# EasyEDA Pro project dtu-core-v2.epro

# Schematic Schematic1

## Sheets
1 P1: Assembly Variant: Basic; Board Name: Board1; Create Date: 2026-10-09; Page Name: P1; Project Name: DTU-C5-Air780EPT-HW-V0.1; Schematic Name: Schematic1; Update Date: 2026-10-09; Company: 嘉立创EDA; Page Size: A4; Version: V1.0
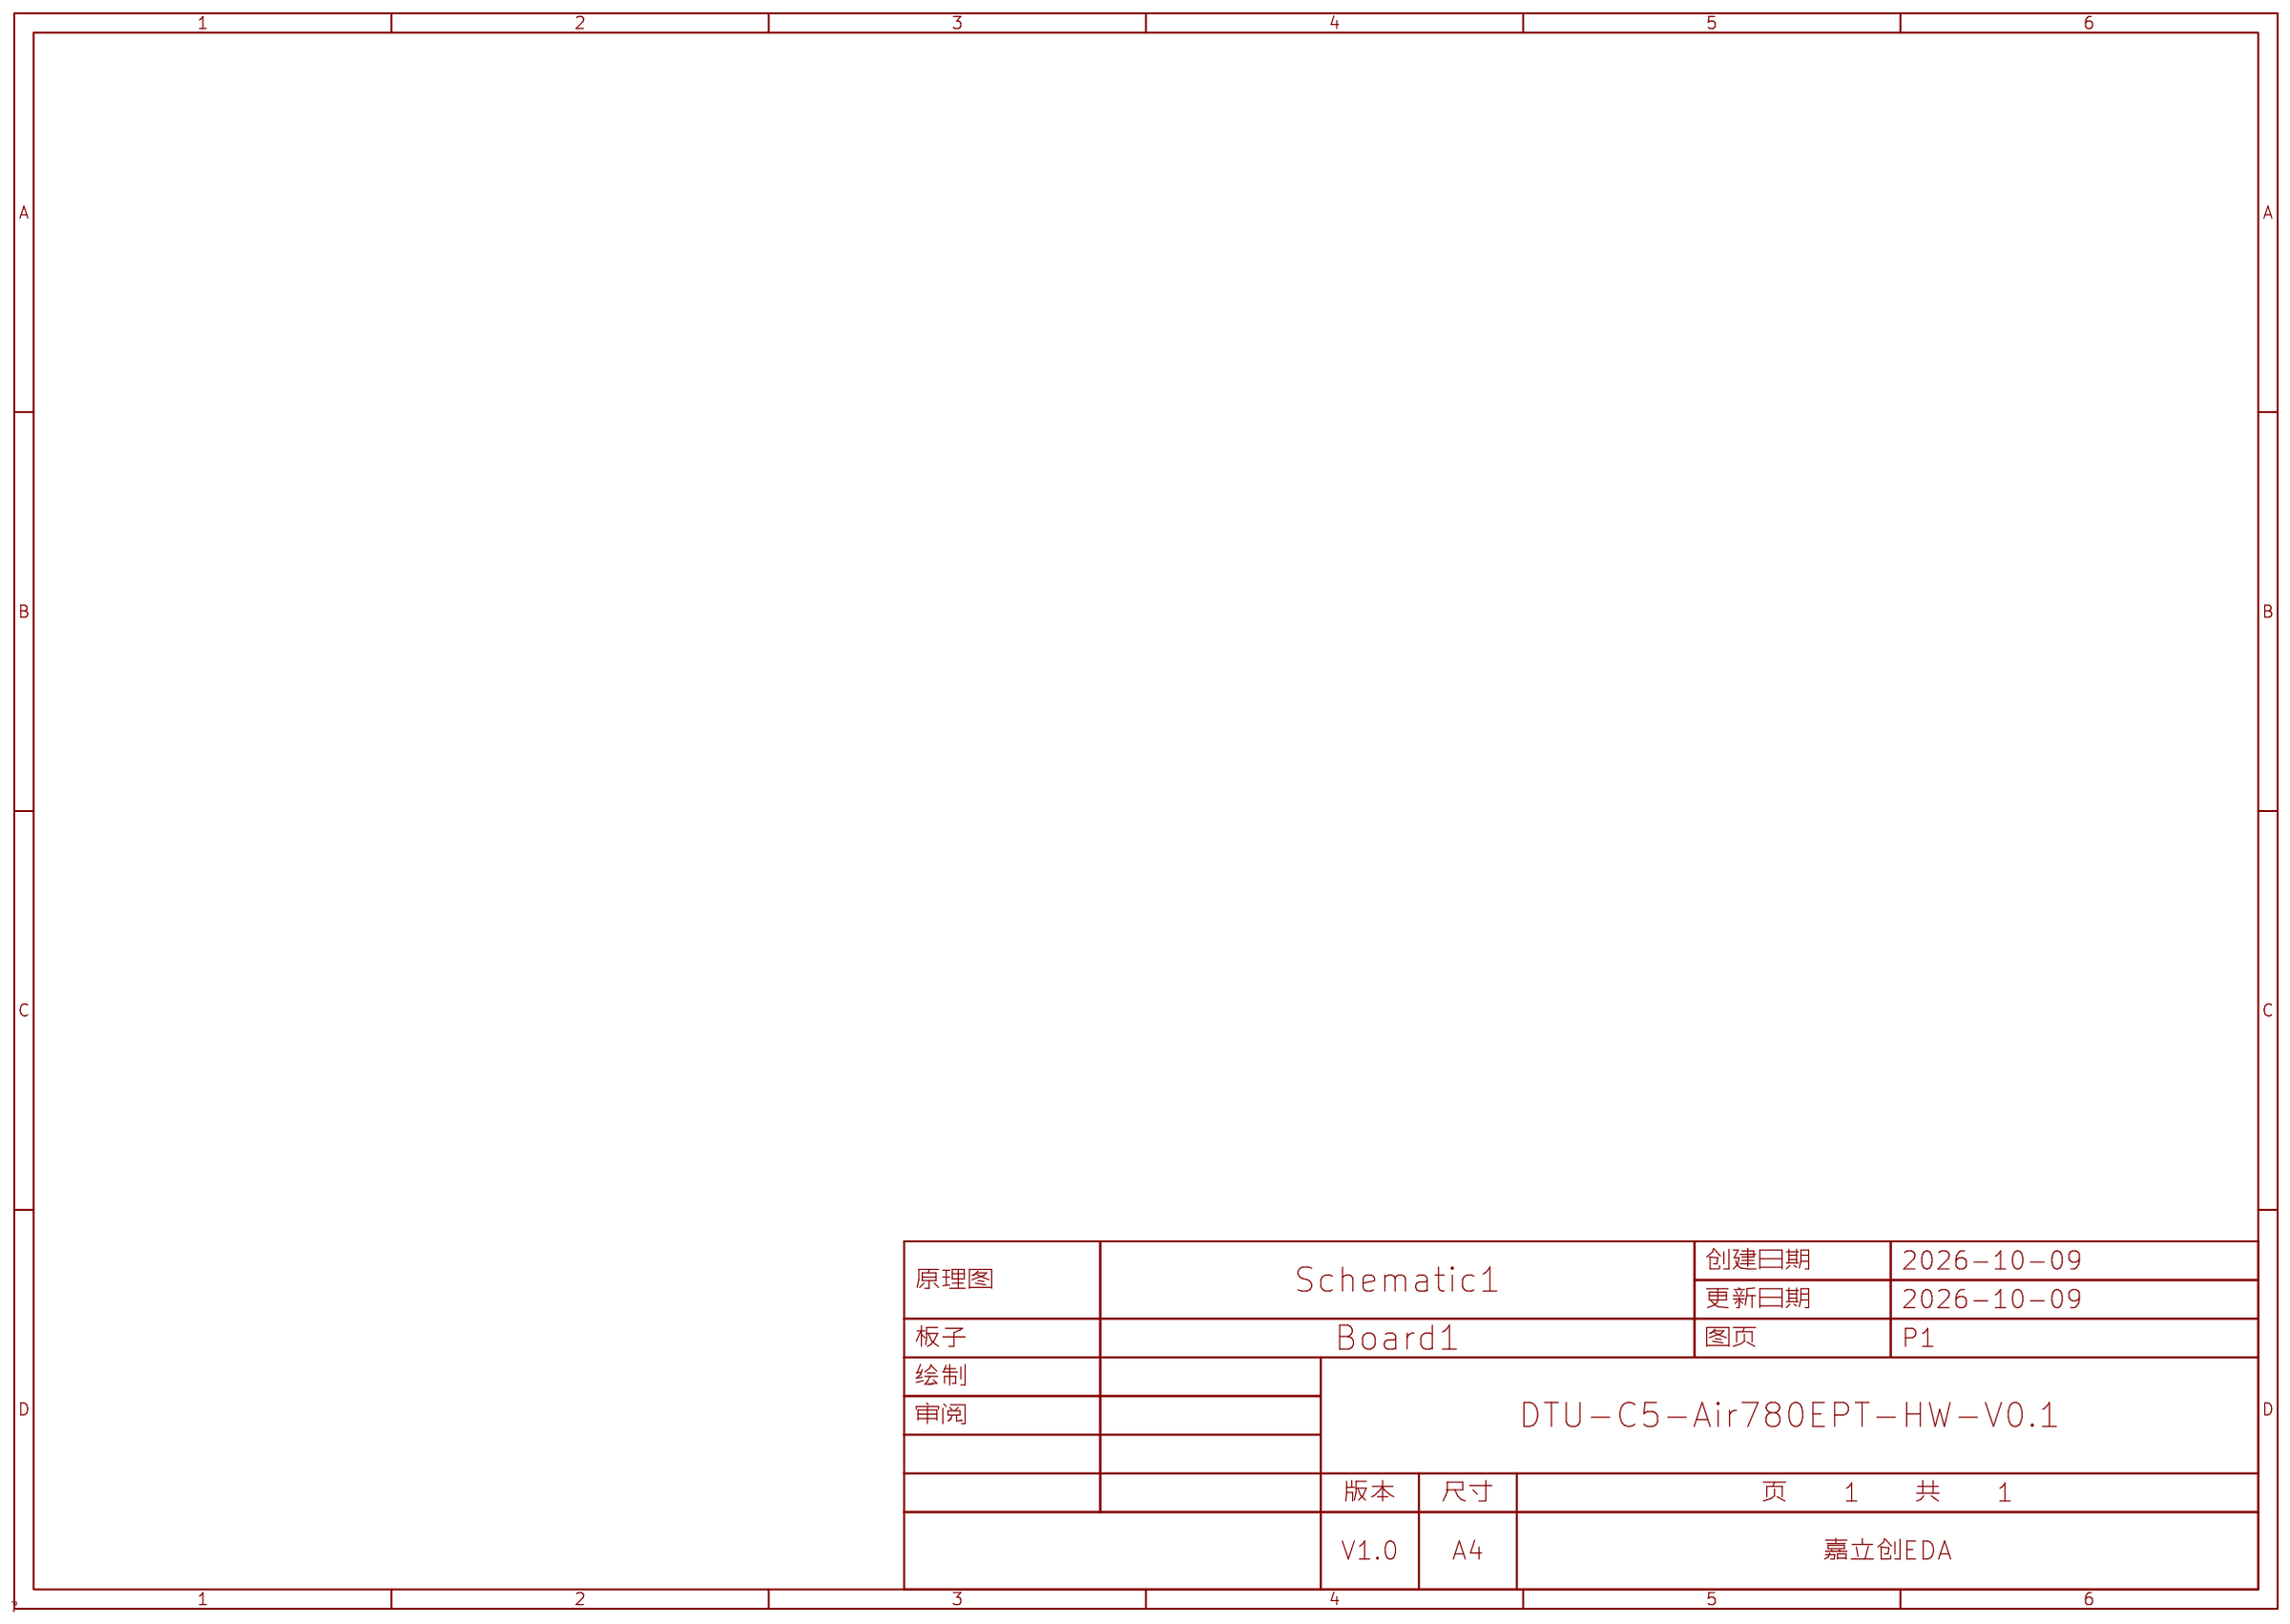
[diagram p0: P1]
2 02_ESP32_C5: Page Name: P2
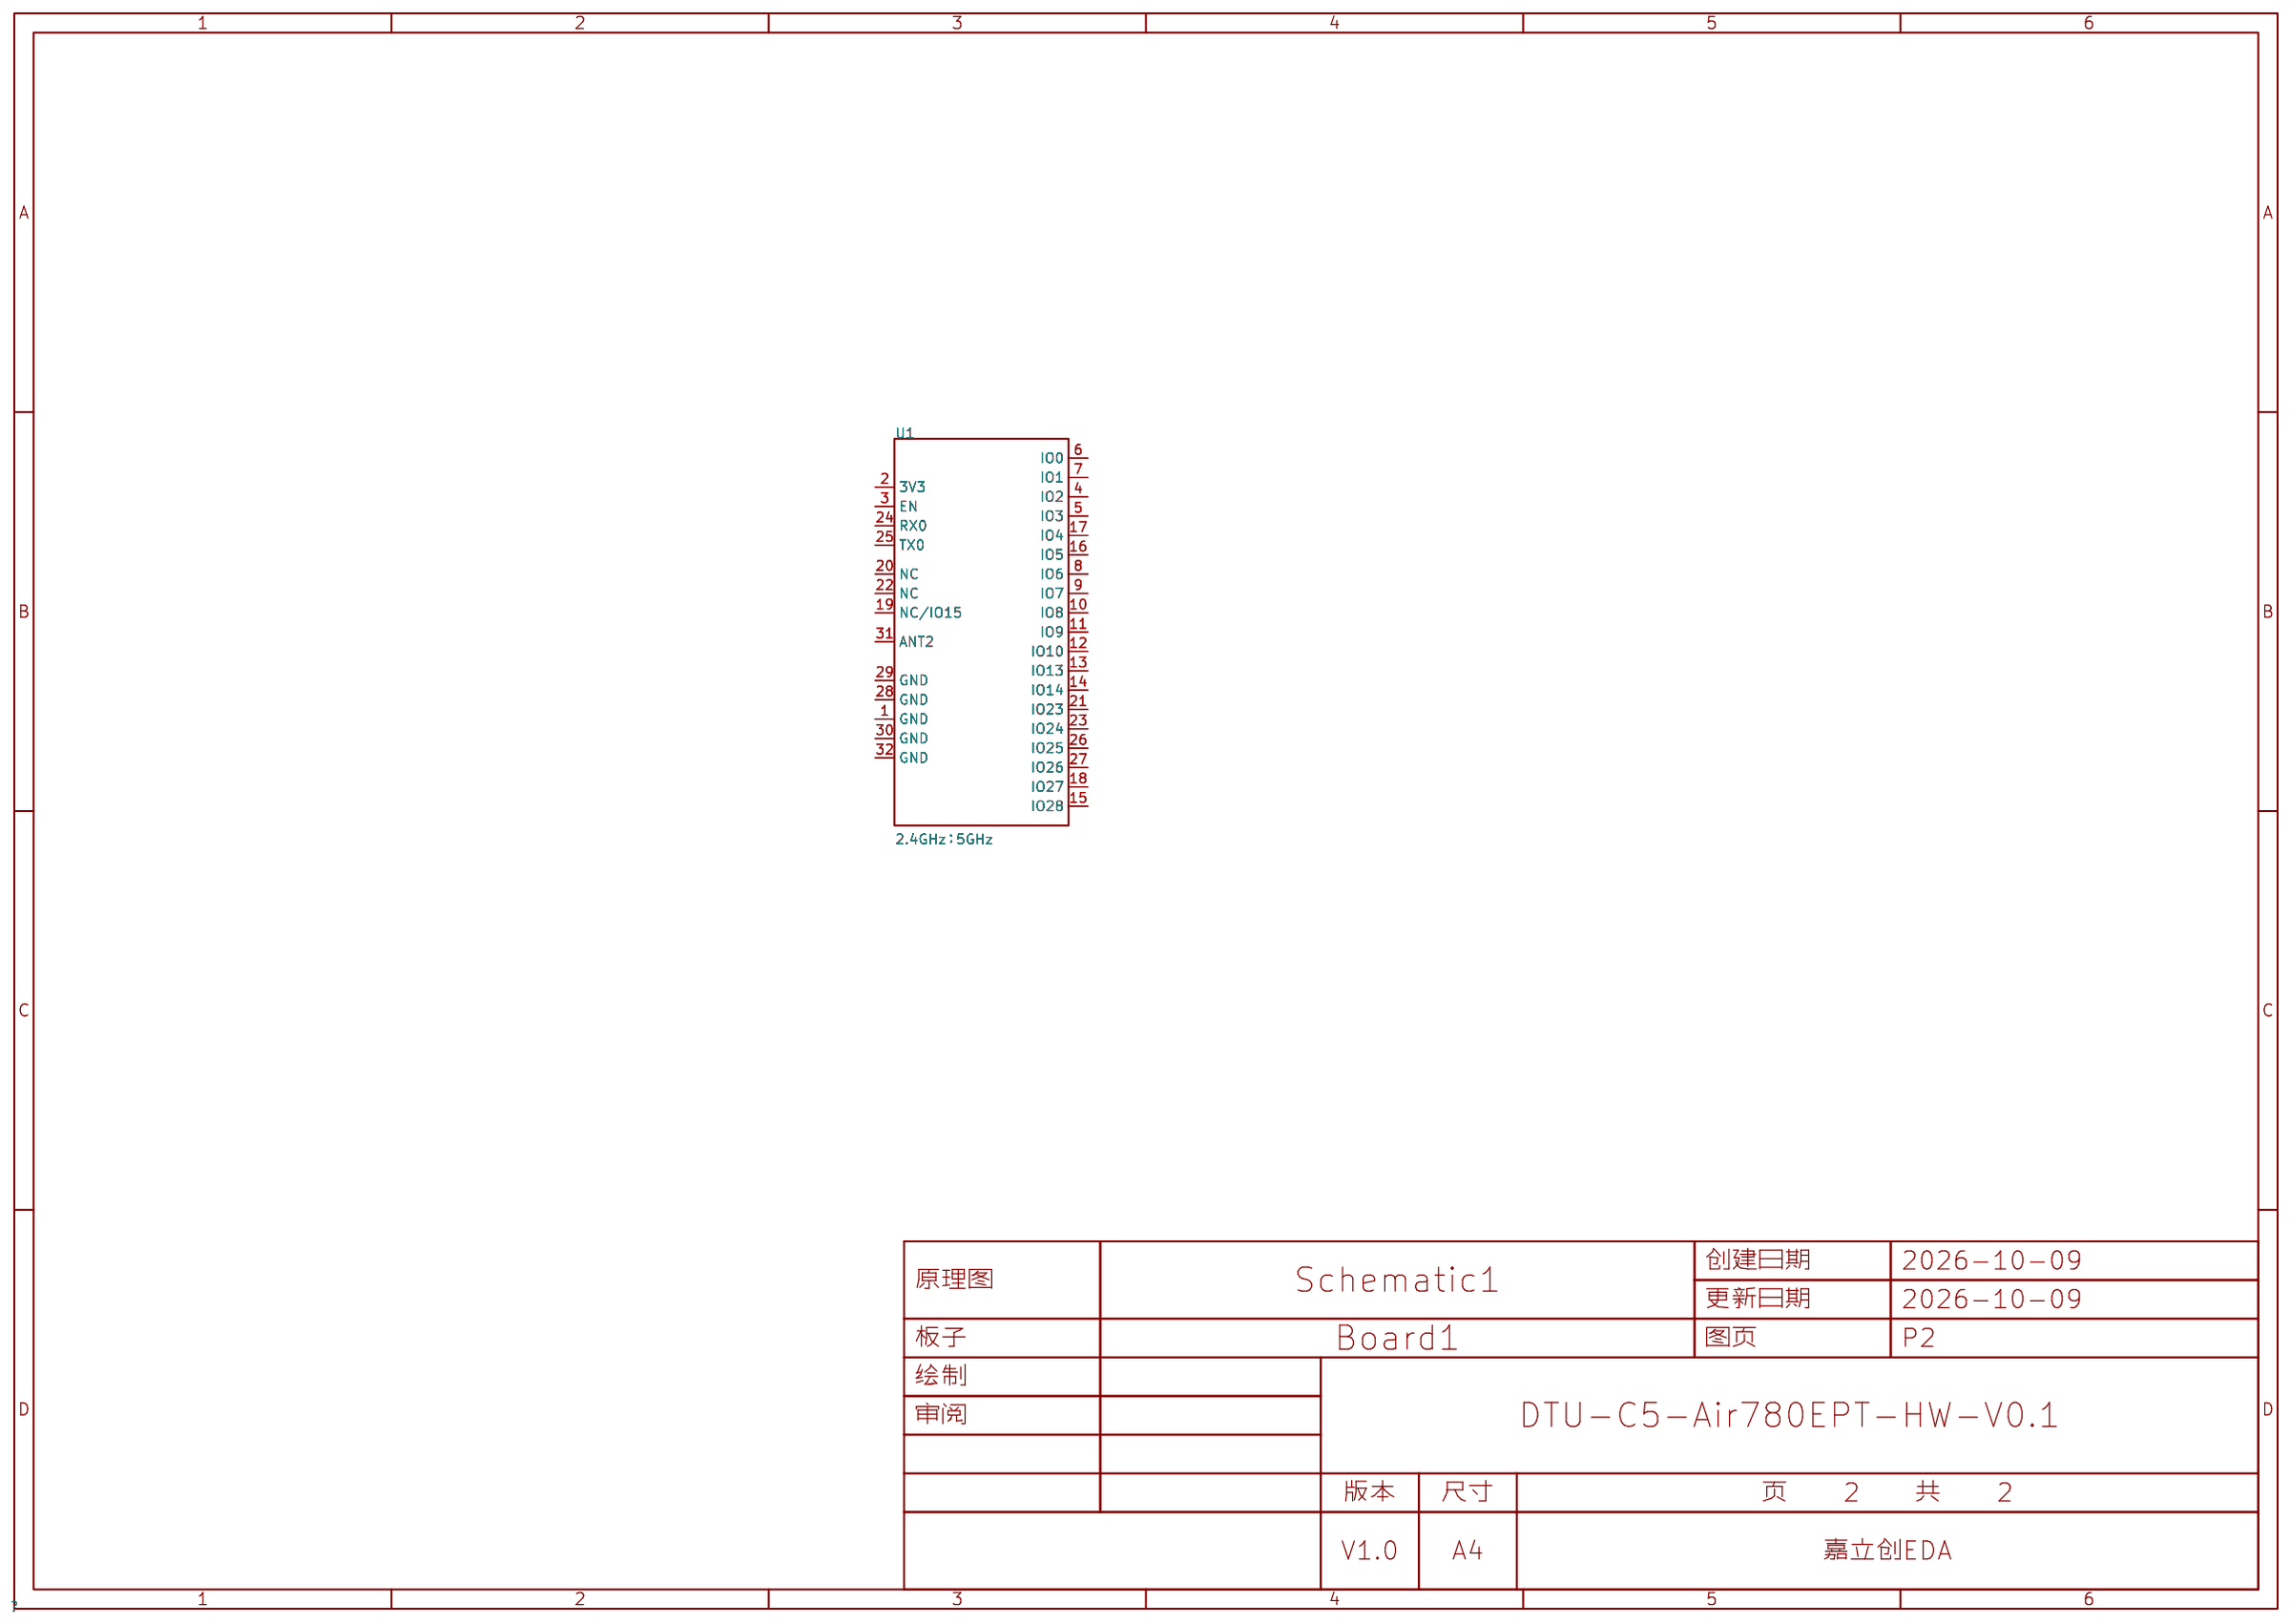
[diagram p1: 02_ESP32_C5]
3 03_Air780EPT: Page Name: P3
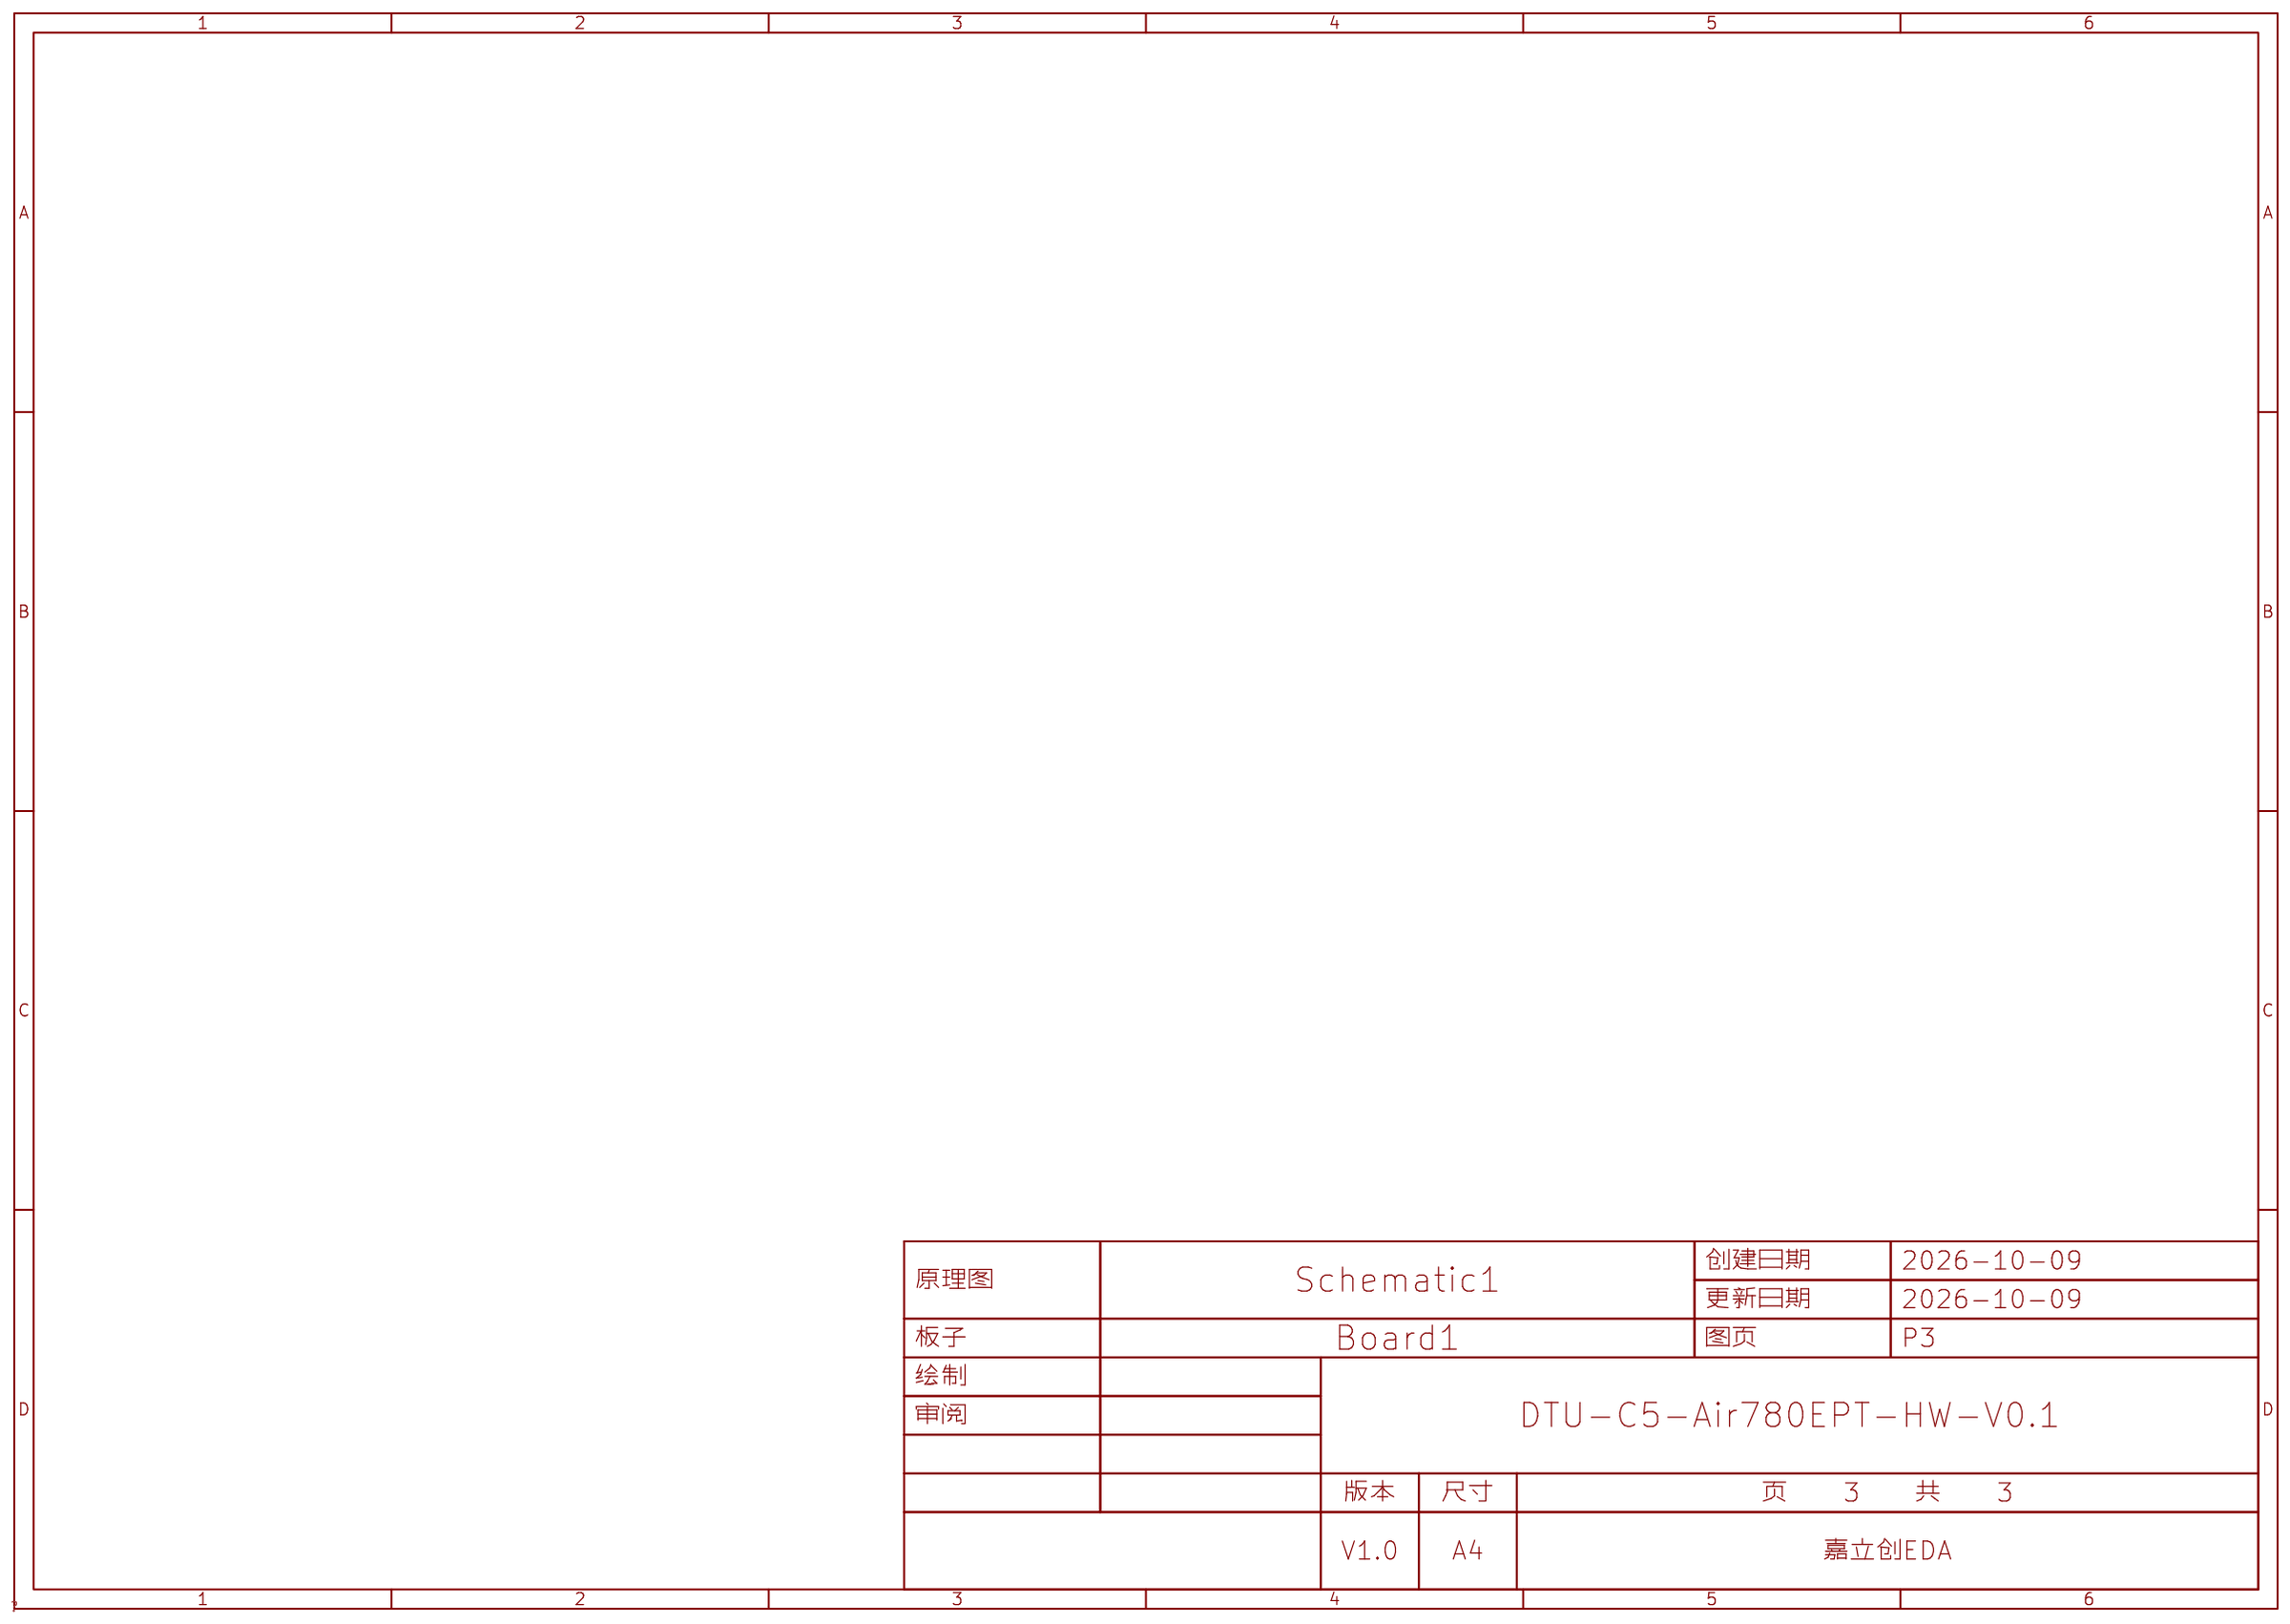
[diagram p2: 03_Air780EPT]
4 P3: Page Name: P3
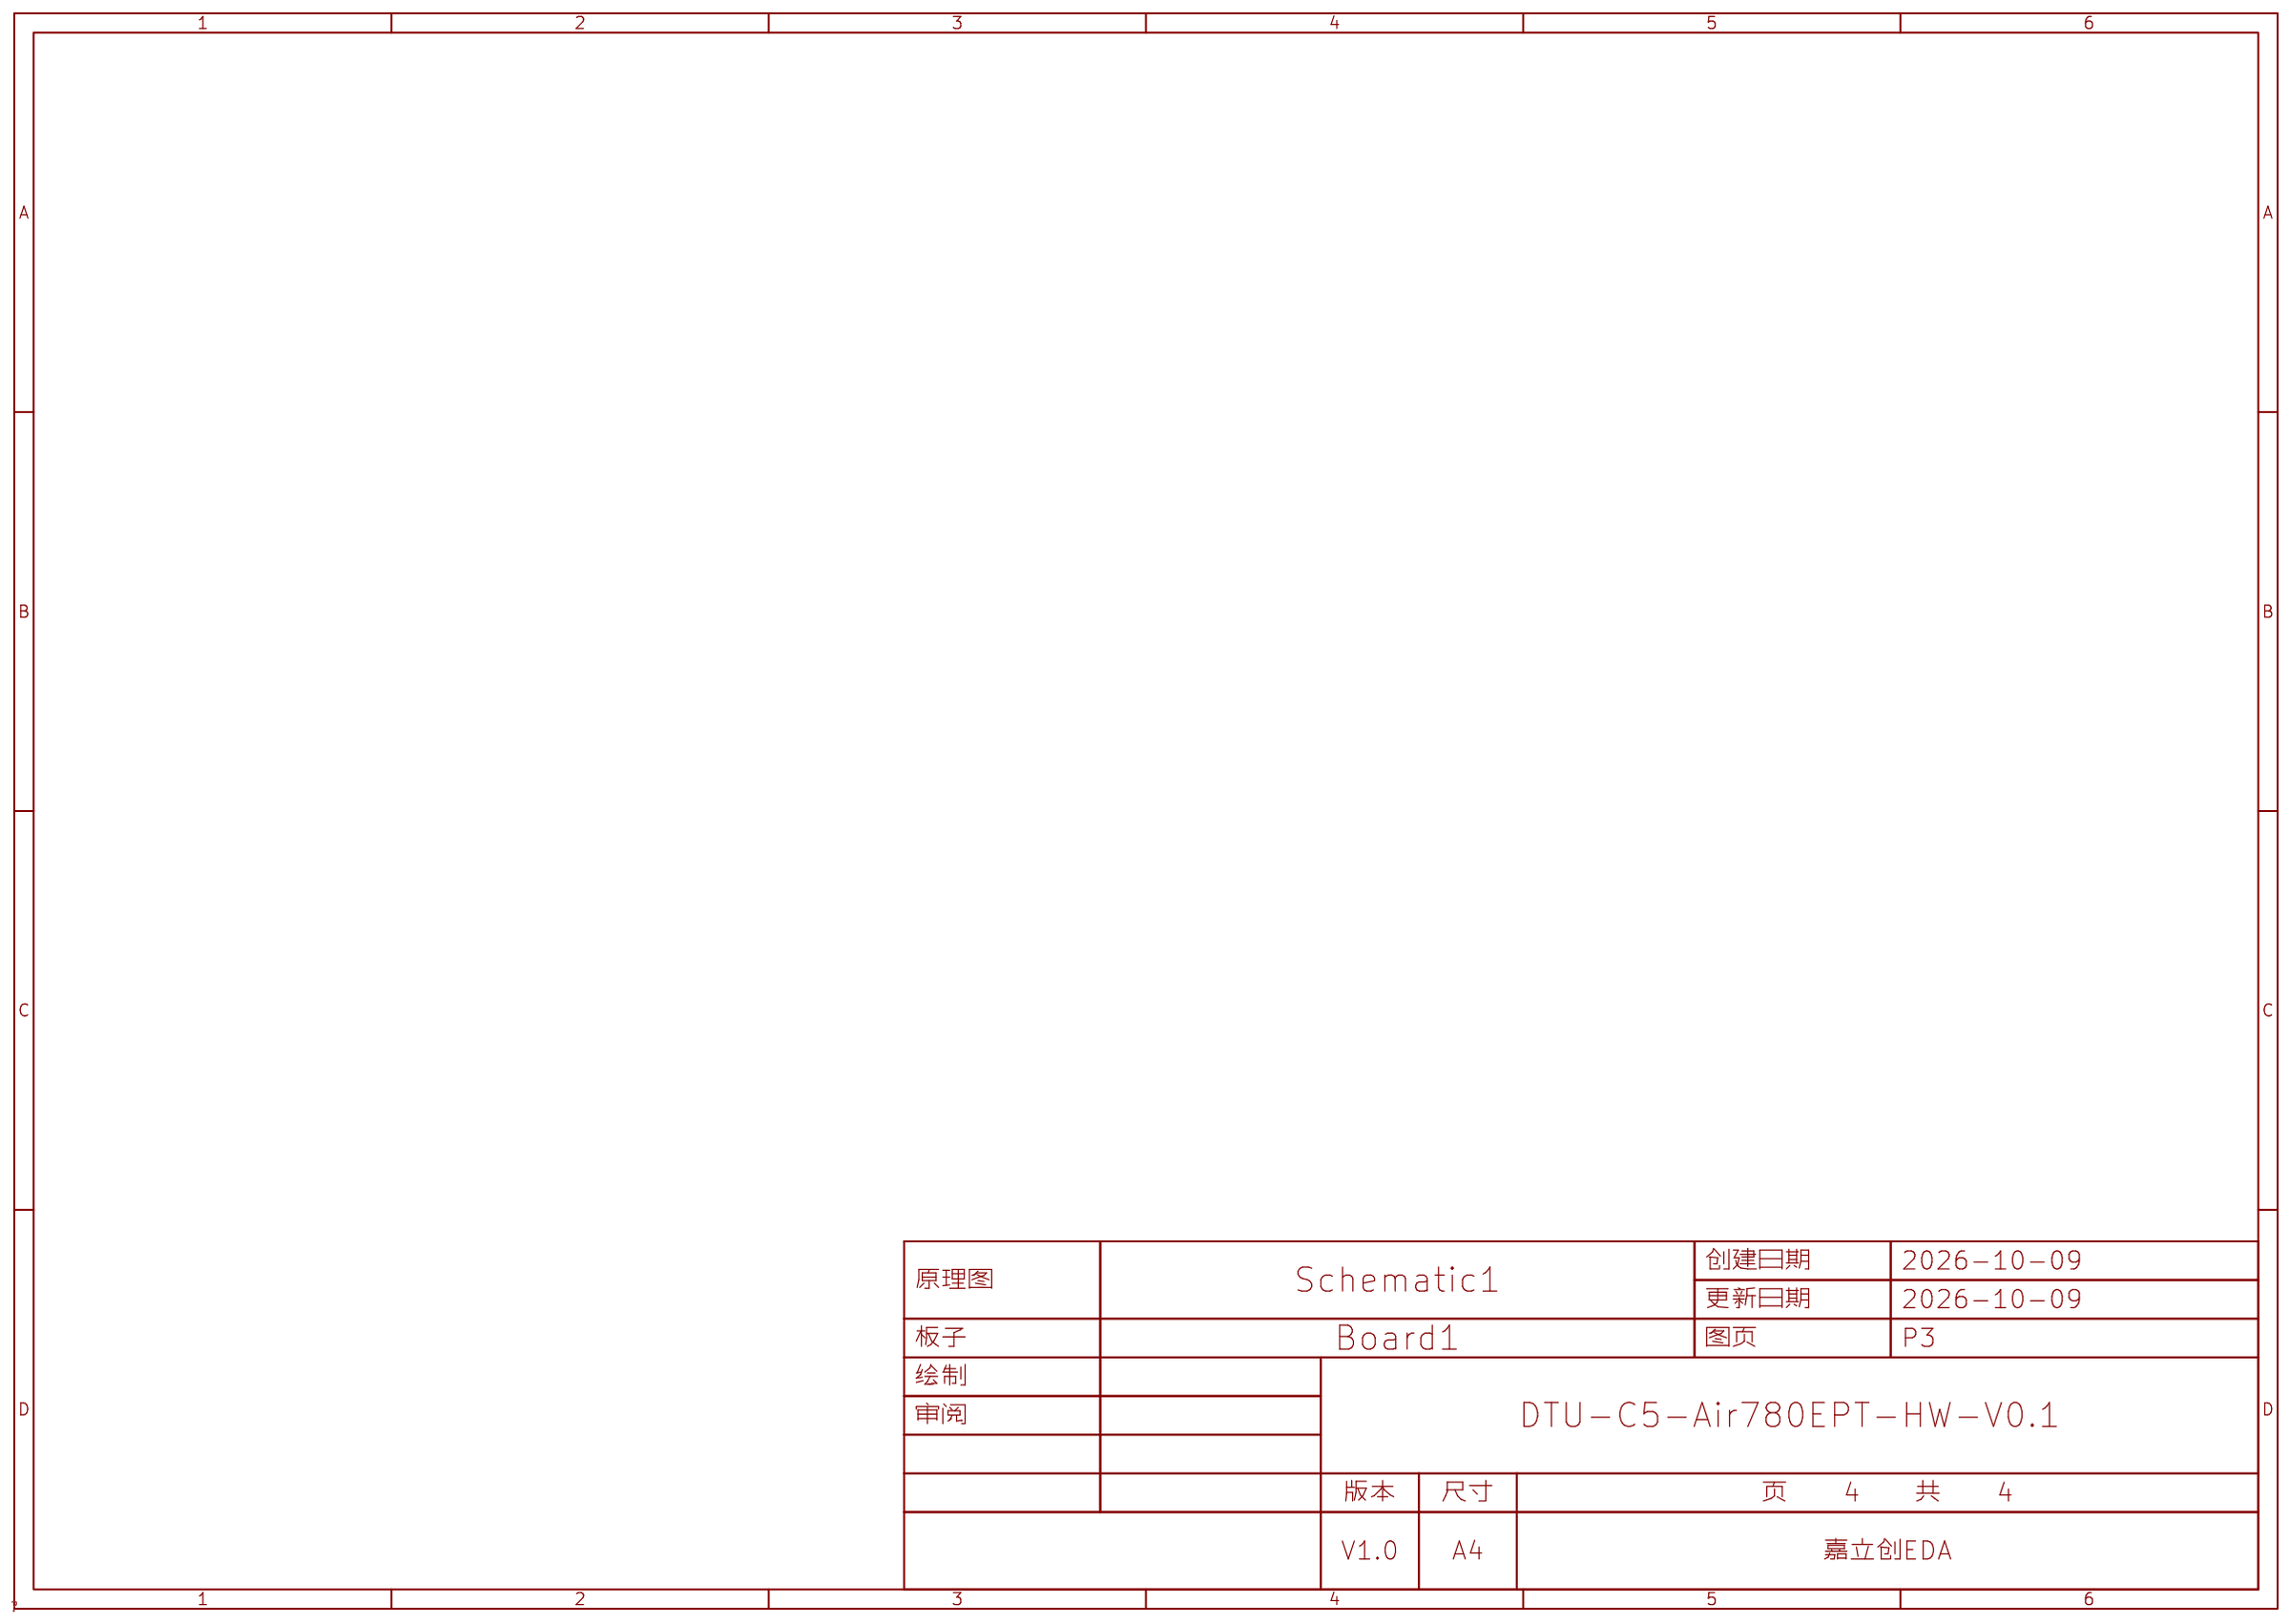
[diagram p3: P3]
5 05_Field_Interfaces: Page Name: P4
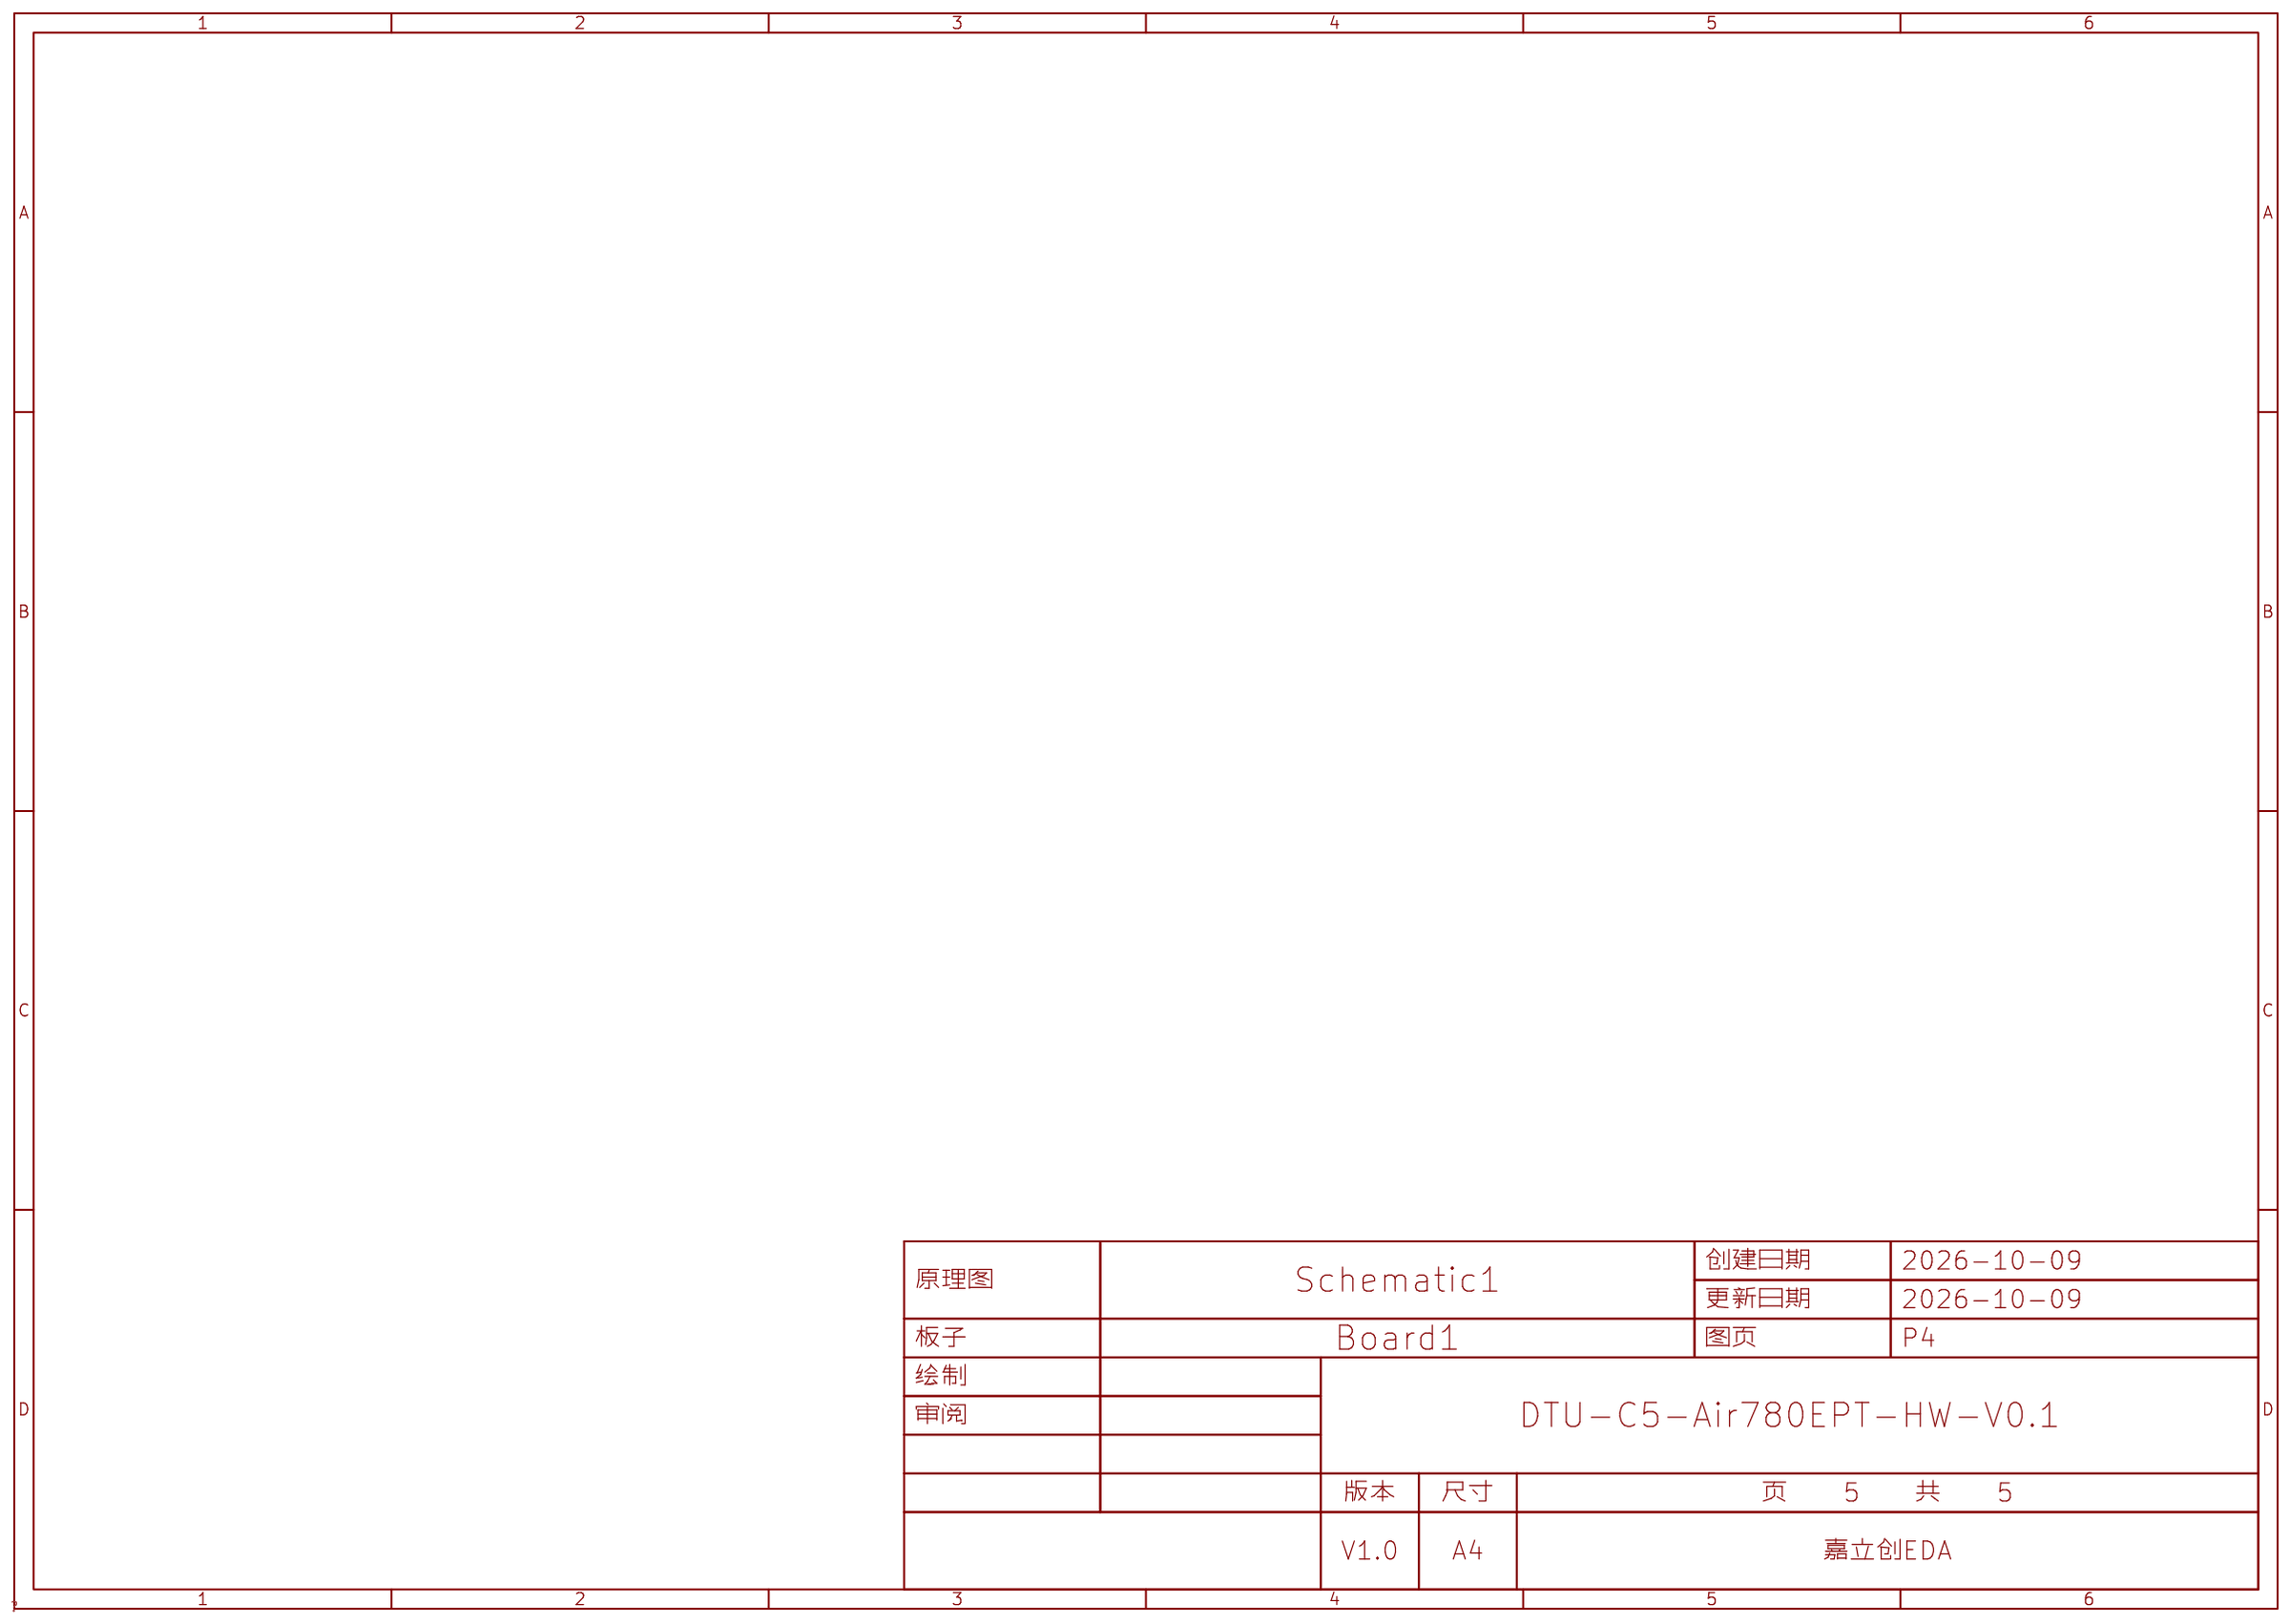
[diagram p4: 05_Field_Interfaces]

## Parts
U1  2.4GHz；5GHz  [COMM-SMD_32P-L21.2-W18.0_ESP32-C5-WROOM-1U]

## Library data of the parts
U1 = ESP32-C5-WROOM-1U-N8R4_C49308183: 核心芯片:ESP32-C5;频率:2.4GHz；5GHz;发射功率:17.5dBm；19.5dBm;接收灵敏度:-100dBm;; LCSC Part Name: 不带固件 2.4&5 GHz双频Wi-Fi6、Bluetooth5、Zigbee及Thread模组; Supplier Part: C49308183; Manufacturer: ESPRESSIF(乐鑫); Manufacturer Part: ESP32-C5-WROOM-1U-N8R4; Supplier Footprint: SMD,21.2x18mm; JLCPCB Part Class: Extended Part; Datasheet: https://item.szlcsc.com/datasheet/ESP32-C5-WROOM-1U-N8R4/51773997.html; Supplier: LCSC; Utilized IC / Part: ESP32-C5; Wireless Standard: Bluetooth5.0; Interface Type: I2C；GPIO；UART；SPI；SDIO；USB；I2S; Output Power: 17.5dBm；19.5dBm; Voltage - Supply: 3V~3.6V; Receive  Current: 121mA；94mA; Send  Current: 397mA；337mA; Sensitivity: -100dBm; Operating Temperature: -40℃~+85℃; Features: 集成蓝牙功能；集成Zigbee功能；支持USB接口; PCB Layer: Default

## Nets

Not connected (* = marked no-connect by the designer): U1 1(GND) 2(3V3) 3(EN) 4(IO2) 5(IO3) 6(IO0) 7(IO1) 8(IO6) 9(IO7) 10(IO8) 11(IO9) 12(IO10) 13(IO13) 14(IO14) 15(IO28) 16(IO5) 17(IO4) 18(IO27) 19(NC/IO15) 20(NC) 21(IO23) 22(NC) 23(IO24) 24(RX0) 25(TX0) 26(IO25) 27(IO26) 28(GND) 29(GND) 30(GND) 31(ANT2) 32(GND)
